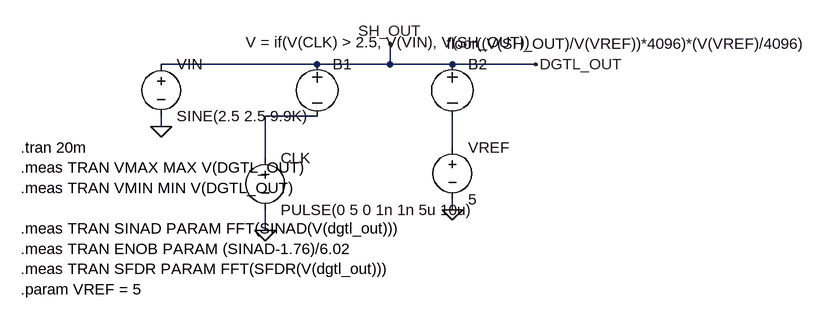
[diagram p0: schematic Draft2.asc]
Draft2.asc, the LTspice schematic file:
Version 4.1
SHEET 1 880 680
WIRE 208 64 -32 64
WIRE 320 64 320 32
WIRE 320 64 208 64
WIRE 416 64 320 64
WIRE 544 64 416 64
WIRE 208 144 128 144
WIRE -32 160 -32 144
WIRE 416 192 416 144
WIRE 128 208 128 144
WIRE 416 288 416 272
WIRE 128 320 128 288
FLAG -32 160 0
FLAG 128 320 0
FLAG 416 288 0
FLAG 544 64 DGTL_OUT
FLAG 320 32 SH_OUT
SYMBOL voltage -32 48 R0
WINDOW 3 24 96 Left 0
SYMATTR InstName VIN
SYMATTR Value SINE(2.5 2.5 9.9K)
SYMBOL lib\\sym\\bv 208 48 R0
WINDOW 3 -110 -18 Left 0
SYMATTR InstName B1
SYMATTR Value V = if(V(CLK) > 2.5, V(VIN), V(SH_OUT))
SYMBOL lib\\sym\\bv 416 48 R0
WINDOW 3 -9 -16 Left 0
SYMATTR InstName B2
SYMATTR Value floor((V(SH_OUT)/V(VREF))*4096)*(V(VREF)/4096)
SYMBOL voltage 128 192 R0
WINDOW 3 24 96 Left 0
SYMATTR InstName CLK
SYMATTR Value PULSE(0 5 0 1n 1n 5u 10u)
SYMBOL voltage 416 176 R0
WINDOW 123 0 0 Left 0
WINDOW 39 0 0 Left 0
SYMATTR InstName VREF
SYMATTR Value 5
TEXT -248 192 Left 0 !.tran 20m\n.meas TRAN VMAX MAX V(DGTL_OUT)\n.meas TRAN VMIN MIN V(DGTL_OUT)\n \n.meas TRAN SINAD PARAM FFT(SINAD(V(dgtl_out)))\n.meas TRAN ENOB PARAM (SINAD-1.76)/6.02\n.meas TRAN SFDR PARAM FFT(SFDR(V(dgtl_out)))\n.param VREF = 5

The netlist it stands for:
* Draft2.asc
VIN SH_OUT 0 SINE(2.5 2.5 9.9K)
B1 SH_OUT N001 V = if(V(CLK) > 2.5, V(VIN), V(SH_OUT))
B2 SH_OUT N002 floor((V(SH_OUT)/V(VREF))*4096)*(V(VREF)/4096)
V§CLK N001 0 PULSE(0 5 0 1n 1n 5u 10u)
VREF N002 0 5
.tran 20m
.meas TRAN VMAX MAX V(DGTL_OUT)
.meas TRAN VMIN MIN V(DGTL_OUT)
.meas TRAN SINAD PARAM FFT(SINAD(V(dgtl_out)))
.meas TRAN ENOB PARAM (SINAD-1.76)/6.02
.meas TRAN SFDR PARAM FFT(SFDR(V(dgtl_out)))
.param VREF = 5
.backanno
.end